# Altium schematic sheet Top_Sheet.SchDoc
size 420 x 297 mm; SheetNumber: 1; SheetTotal: 3
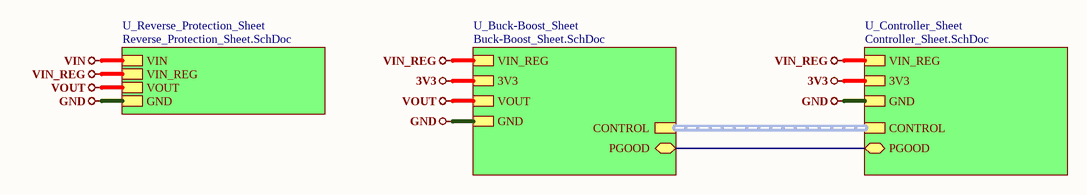
[diagram p0: Top_Sheet.SchDoc]

## Sub-sheets
U_Buck-Boost_Sheet = Buck-Boost_Sheet.SchDoc: CONTROL (harness CONTROL), PGOOD (bidir), GND, 3V3, VOUT, VIN_REG
U_Controller_Sheet = Controller_Sheet.SchDoc: CONTROL (harness CONTROL), PGOOD (bidir), GND, 3V3, VIN_REG
U_Reverse_Protection_Sheet = Reverse_Protection_Sheet.SchDoc: GND, VIN_REG, VIN, VOUT

## Nets
3V3: sheet U_Controller_Sheet/3V3, sheet U_Buck-Boost_Sheet/3V3
GND: sheet U_Controller_Sheet/GND, sheet U_Buck-Boost_Sheet/GND, sheet U_Reverse_Protection_Sheet/GND
VIN: sheet U_Reverse_Protection_Sheet/VIN
VIN_REG: sheet U_Controller_Sheet/VIN_REG, sheet U_Buck-Boost_Sheet/VIN_REG, sheet U_Reverse_Protection_Sheet/VIN_REG
VOUT: sheet U_Buck-Boost_Sheet/VOUT, sheet U_Reverse_Protection_Sheet/VOUT
(unnamed): sheet U_Controller_Sheet/PGOOD, sheet U_Buck-Boost_Sheet/PGOOD

## Buses and harness runs
harness sheet U_Buck-Boost_Sheet/CONTROL = sheet U_Controller_Sheet/CONTROL

## Notes on the sheet
- File:
- Title:
- Date:
- Page
- Num:
- Total:
- Drawn By: Huzaifa Ali